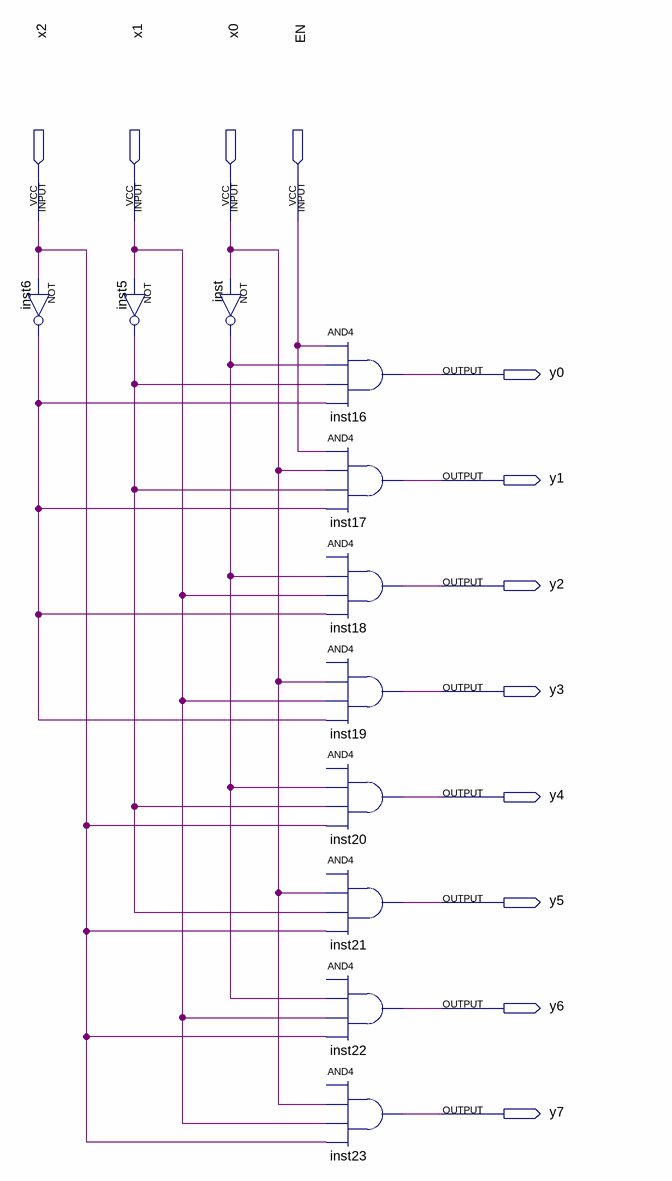
[diagram p0: schematic sheet]
// Quartus schematic 8DC.bdf as structural Verilog: 11 symbols, 12 pins
module \8DC  (
  input  x2,
  input  x1,
  input  x0,
  input  EN,
  output y0,
  output y1,
  output y2,
  output y3,
  output y4,
  output y5,
  output y6,
  output y7
);

  wire inst5_out, inst6_out, inst_out;

  not inst6 (inst6_out, x2);
  not inst5 (inst5_out, x1);
  not inst (inst_out, x0);
  and inst16 (y0, EN, inst_out, inst5_out, inst6_out);
  and inst17 (y1, EN, x0, inst5_out, inst6_out);
  and inst18 (y2, inst_out, x1, inst6_out);  // open: IN1
  and inst19 (y3, x0, x1, inst6_out);  // open: IN1
  and inst20 (y4, inst_out, inst5_out, x2);  // open: IN1
  and inst21 (y5, x0, inst5_out, x2);  // open: IN1
  and inst22 (y6, inst_out, x1, x2);  // open: IN1
  and inst23 (y7, x0, x1, x2);  // open: IN1
endmodule
